# EasyEDA Pro project ProPrj_stm32桌面宠物_2024-10-04.epro

# Schematic stm32桌面宠物
Board Name: stm32桌面宠物; Create Date: 2024-09-05
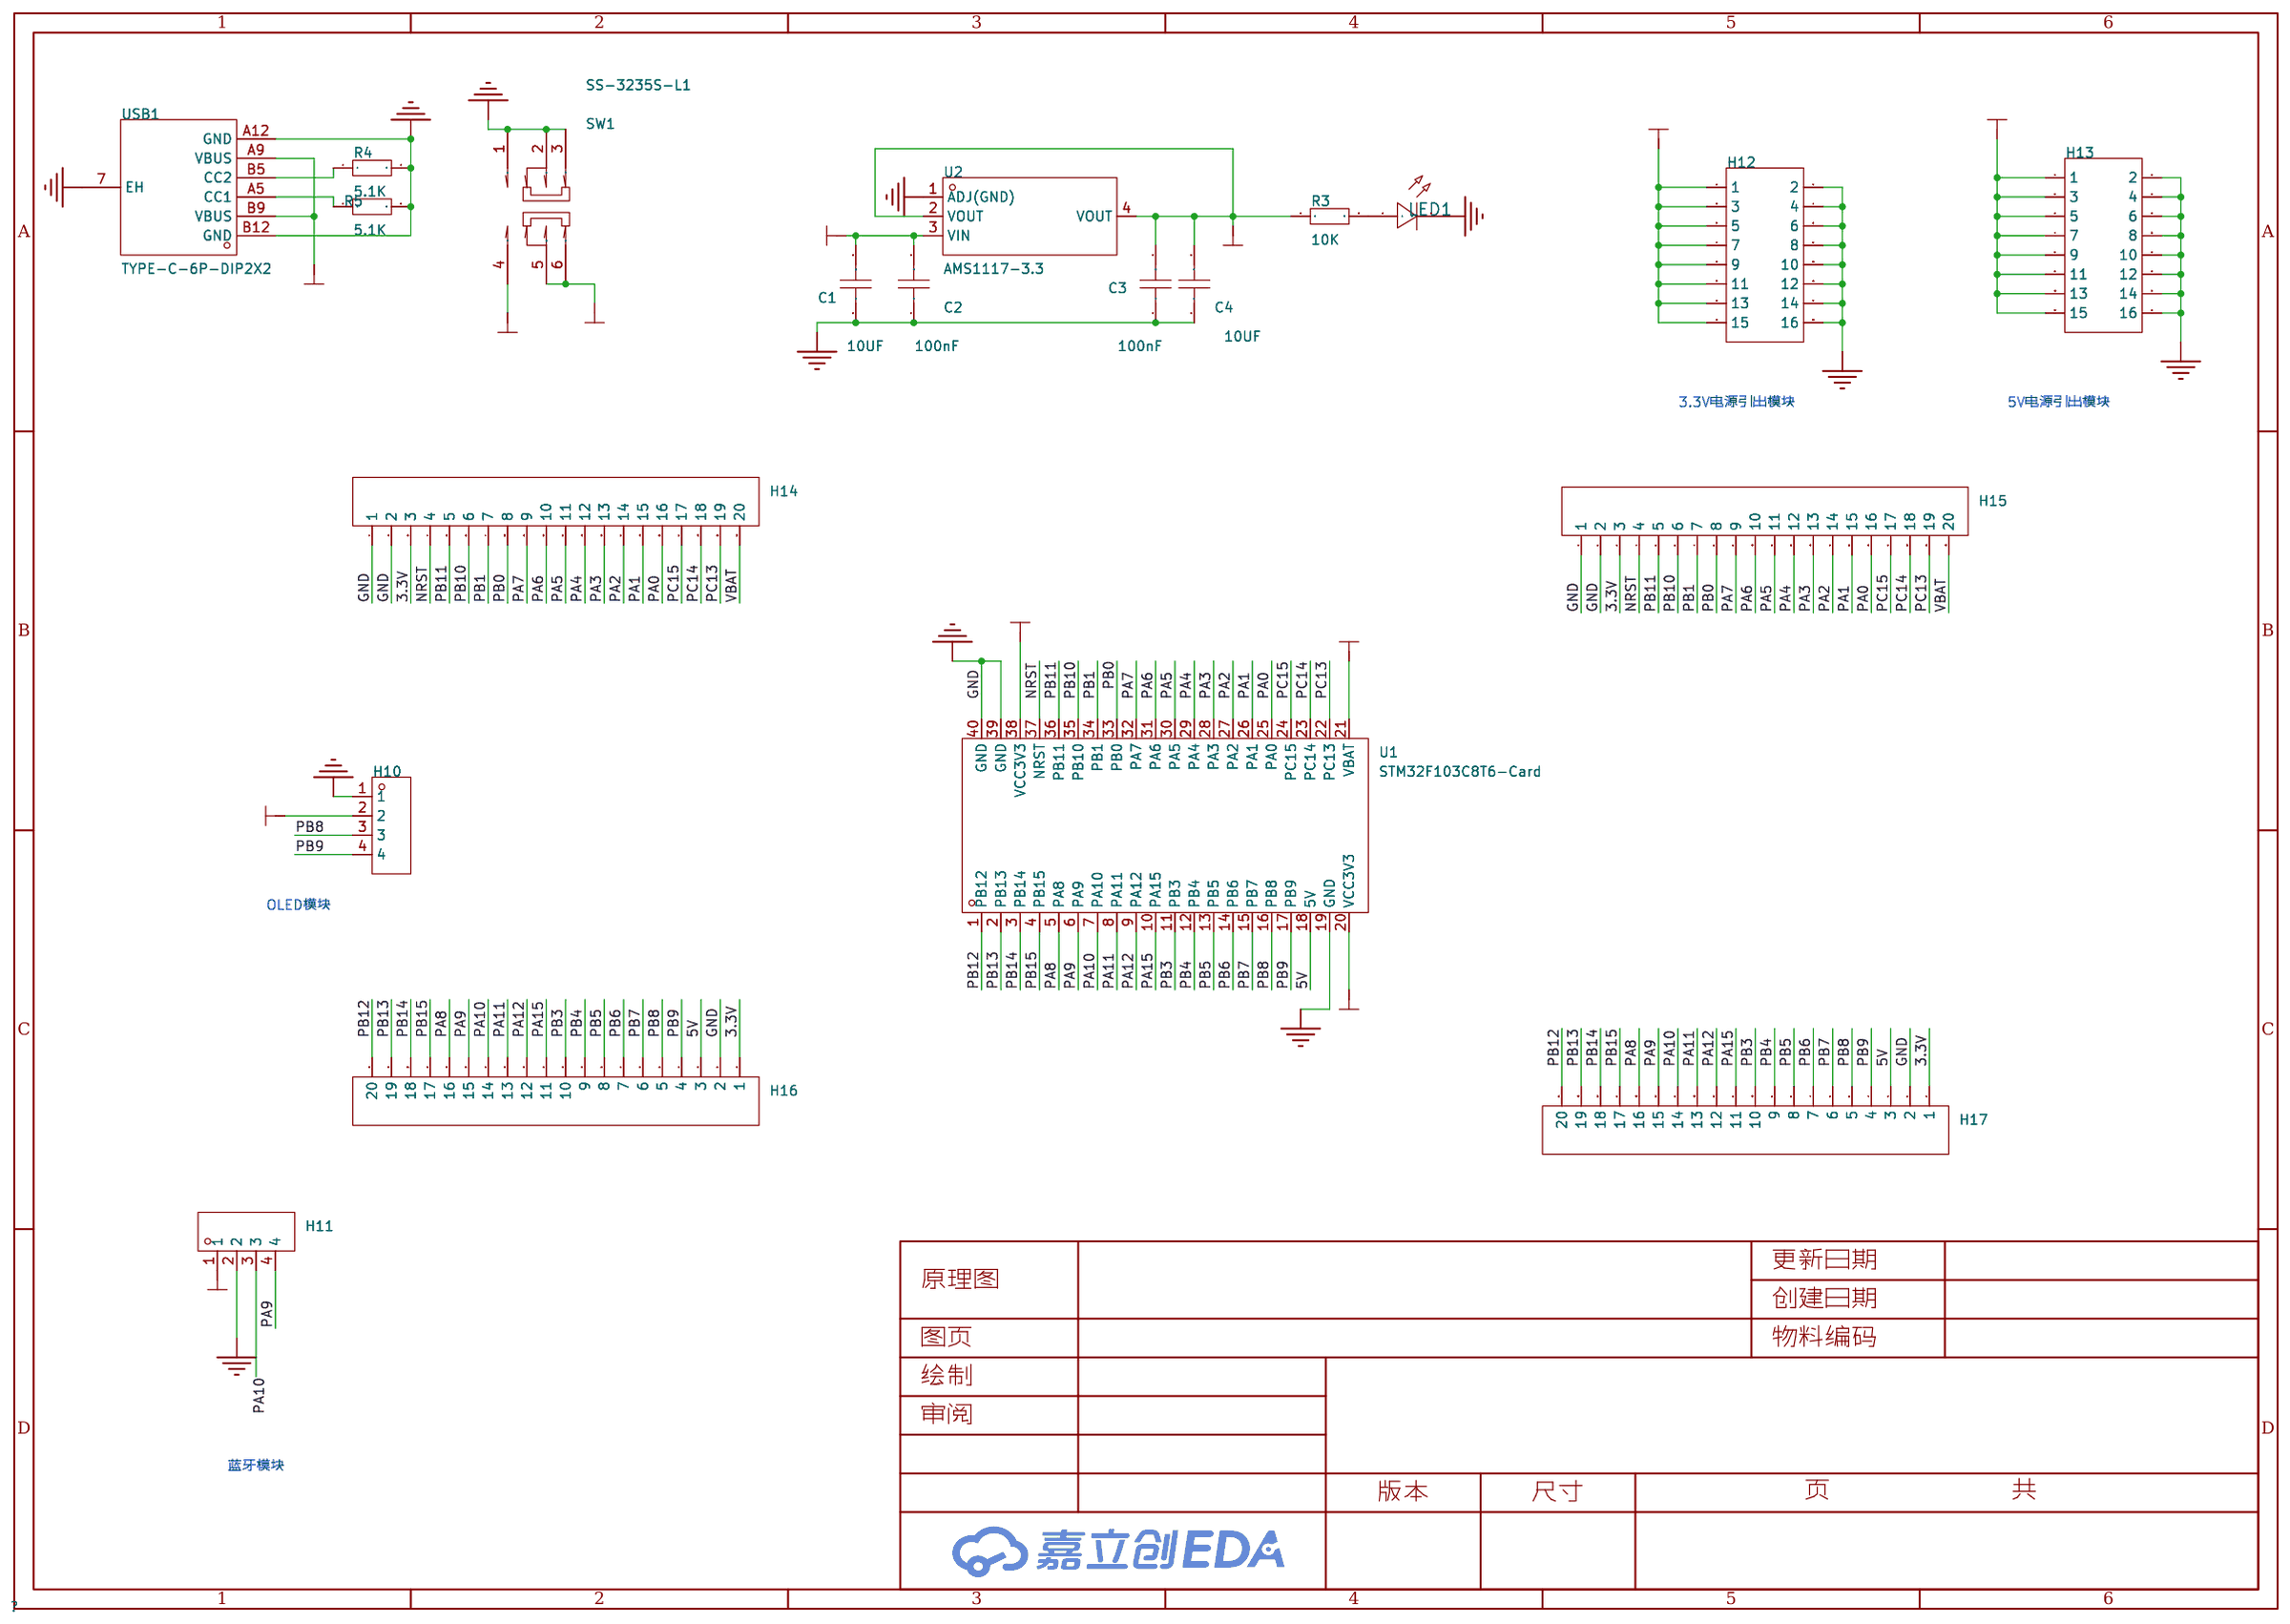
[diagram p0: schematic sheet]

## Parts
C1  10UF  [C0805]
C2  100nF  [C0805]
C3  100nF  [C0805]
C4  10UF  [C0805]
H10  -  [HDR-TH_4P-P2.54-V-F]
H11  -  [HDR-TH_4P-P2.54-V-F]
H12  -  [HDR-TH_16P-P2.54-V-M-R2-C8-S2.54]
H13  -  [HDR-TH_16P-P2.54-V-M-R2-C8-S2.54]
H14  -  [HDR-TH_20P-P2.54-V-F]
H15  -  [HDR-TH_20P-P2.54-V-F]
H16  -  [HDR-TH_20P-P2.54-V-F]
H17  -  [HDR-TH_20P-P2.54-V-F]
LED1  -  [LED_0805]
R3  10K  [R0805]
R4  5.1K  [R0805]
R5  5.1K  [R0805]
SW1  SS-3235S-L1  [SW-SMD_SS-3235S-LX]
U1  STM32F103C8T6-Card  [CONN-TH_L53.3-W22.9_STM32F103C8T6-CARD]
U2  AMS1117-3.3  [SOT-223-3_L6.5-W3.4-P2.30-LS7.0-BR]
USB1  TYPE-C-6P-DIP2X2  [TYPE-C-SMD_TYPE-C-6P]

## Library data of the parts
C1-C4 = CAP_0805: Supplier Footprint: 0805
H10 H11 = HDR-F_2.54_1x4P: Supplier Part: C2718488; Supplier Footprint: 插件
H12 H13 = HDR-M_2.54_2x8: Supplier Part: C68234; Supplier Footprint: 插件,P=2.54mm
H14-H17 = HDR-F_2.54_1x20P: Supplier Part: C50984; Supplier Footprint: 插件
LED1 = LED_0805-R: Supplier Footprint: 0805
R3-R5 = Res_0805: Supplier Footprint: 0805
SW1 = SS-3235S-L1: 电路结构:双刀双掷;安装方式:卧贴;开关颜色:黑色;额定电流(DC):50mA;额定电压(DC):12V;额定电流(AC):50mA;额定电压(AC):12V;机械寿命:1万次;; LCSC Part Name: 柄长2mm 卧贴双档 滑动开关; Supplier Part: C500055; Manufacturer: XKB Connectivity(中国星坤); Supplier Footprint: SMD; JLCPCB Part Class: 扩展库; Datasheet: https://atta.szlcsc.com/upload/public/pdf/source/20211011/39D516E750C13BE9339464E723D9F132.pdf; Supplier: LCSC; Circuit: 双刀双掷; Actuator Style: 矩形柱状; Pin Style: 鸥翼型; Switch Length: 9.1mm; Switch Width: 3.55mm; Switch Height: 3.2mm; Mounting Style: 卧贴; Actuator Color: 黑色; Current Rating (DC): 50mA; Voltage Rating (DC): 12V; Current Rating (AC): 50mA; Voltage Rating (AC): 12V; Mechanical Life: 1万次; Operating Temperature: -40℃~+85℃
U1 = STM32F103C8T6-Card: Supplier Part: C9900077949; Supplier Footprint: 插件; Supplier: LCSC
U2 = AMS1117-3.3: 输出类型:固定;最大输入电压:18V;输出电压:3.3V;最大输出电流:1A;电源纹波抑制比(PSRR):60dB@(120Hz);输出极性:正极;; LCSC Part Name: 输入18V 输出3.3V 1A; Supplier Part: C2891839; Manufacturer: YONGYUTAI(永裕泰); Supplier Footprint: SOT-223-3; JLCPCB Part Class: 扩展库; Datasheet: https://atta.szlcsc.com/upload/public/pdf/source/20210901/A75ADDE6A17DEE0002F2A58A8D1F3634.pdf; Supplier: LCSC; Output Type: 固定; Maximum Input Voltage: 18V; Output Voltage: 3.3V; MAX Output Current: 1A; Power Supply Rejection Ratio (PSRR): 60dB@(120Hz); Dropout Voltage: 1.3V@(1A); standby current: 5mA; Noise: 0.005%Vout; Operating Temperature: -40℃~+125℃@(Tj); Output Polarity: 正极; Number of Outputs: 1
USB1 = TYPE-C-6P-DIP2X2: Supplier Part: C9900017627; Supplier Footprint: TYPE-C-6P; JLCPCB Part Class: 扩展库; Supplier: LCSC

## Nets
3.3V: C3.2 C4.2 H10.2 H11.1 H12.1 H12.3 H12.5 H12.7 H12.9 H12.11 H12.13 H12.15 H14.3 H15.3 H16.1 H17.1 R3.1 U1.20(VCC3V3) U1.21(VBAT) U1.38(VCC3V3) U2.2(VOUT) U2.4(VOUT)
5V: C1.2 C2.2 H13.1 H13.3 H13.5 H13.7 H13.9 H13.11 H13.13 H13.15 H16.3 H17.3 SW1.5 SW1.6 U1.18(5V) U2.3(VIN)
GND: C1.1 C2.1 C3.1 C4.1 H10.1 H11.2 H12.2 H12.4 H12.6 H12.8 H12.10 H12.12 H12.14 H12.16 H13.2 H13.4 H13.6 H13.8 H13.10 H13.12 H13.14 H13.16 H14.1 H14.2 H15.1 H15.2 H16.2 H17.2 LED1.1(C) R4.2 R5.2 SW1.1 SW1.2 SW1.3 U1.19(GND) U1.39(GND) U1.40(GND) U2.1(ADJ(GND)) USB1.7(EH) USB1.A12(GND) USB1.B12(GND)
VBAT: H14.20 H15.20
VCC5V: SW1.4 USB1.A9(VBUS) USB1.B9(VBUS)
NRST: H14.4 H15.4 U1.37(NRST)
PA0: H14.16 H15.16 U1.25(PA0)
PA1: H14.15 H15.15 U1.26(PA1)
PA2: H14.14 H15.14 U1.27(PA2)
PA3: H14.13 H15.13 U1.28(PA3)
PA4: H14.12 H15.12 U1.29(PA4)
PA5: H14.11 H15.11 U1.30(PA5)
PA6: H14.10 H15.10 U1.31(PA6)
PA7: H14.9 H15.9 U1.32(PA7)
PA8: H16.16 H17.16 U1.5(PA8)
PA9: H11.4 H16.15 H17.15 U1.6(PA9)
PA10: H11.3 H16.14 H17.14 U1.7(PA10)
PA11: H16.13 H17.13 U1.8(PA11)
PA12: H16.12 H17.12 U1.9(PA12)
PA15: H16.11 H17.11 U1.10(PA15)
PB0: H14.8 H15.8 U1.33(PB0)
PB1: H14.7 H15.7 U1.34(PB1)
PB3: H16.10 H17.10 U1.11(PB3)
PB4: H16.9 H17.9 U1.12(PB4)
PB5: H16.8 H17.8 U1.13(PB5)
PB6: H16.7 H17.7 U1.14(PB6)
PB7: H16.6 H17.6 U1.15(PB7)
PB8: H10.3 H16.5 H17.5 U1.16(PB8)
PB9: H10.4 H16.4 H17.4 U1.17(PB9)
PB10: H14.6 H15.6 U1.35(PB10)
PB11: H14.5 H15.5 U1.36(PB11)
PB12: H16.20 H17.20 U1.1(PB12)
PB13: H16.19 H17.19 U1.2(PB13)
PB14: H16.18 H17.18 U1.3(PB14)
PB15: H16.17 H17.17 U1.4(PB15)
PC13: H14.19 H15.19 U1.22(PC13)
PC14: H14.18 H15.18 U1.23(PC14)
PC15: H14.17 H15.17 U1.24(PC15)
$1N801: R4.1 USB1.B5(CC2)
$1N805: R5.1 USB1.A5(CC1)
$1N1622: LED1.2(A) R3.2

## Notes on the sheet
- 3.3V电源引出模块
- 5V电源引出模块
- OLED模块
- 蓝牙模块

# Board stm32桌面宠物
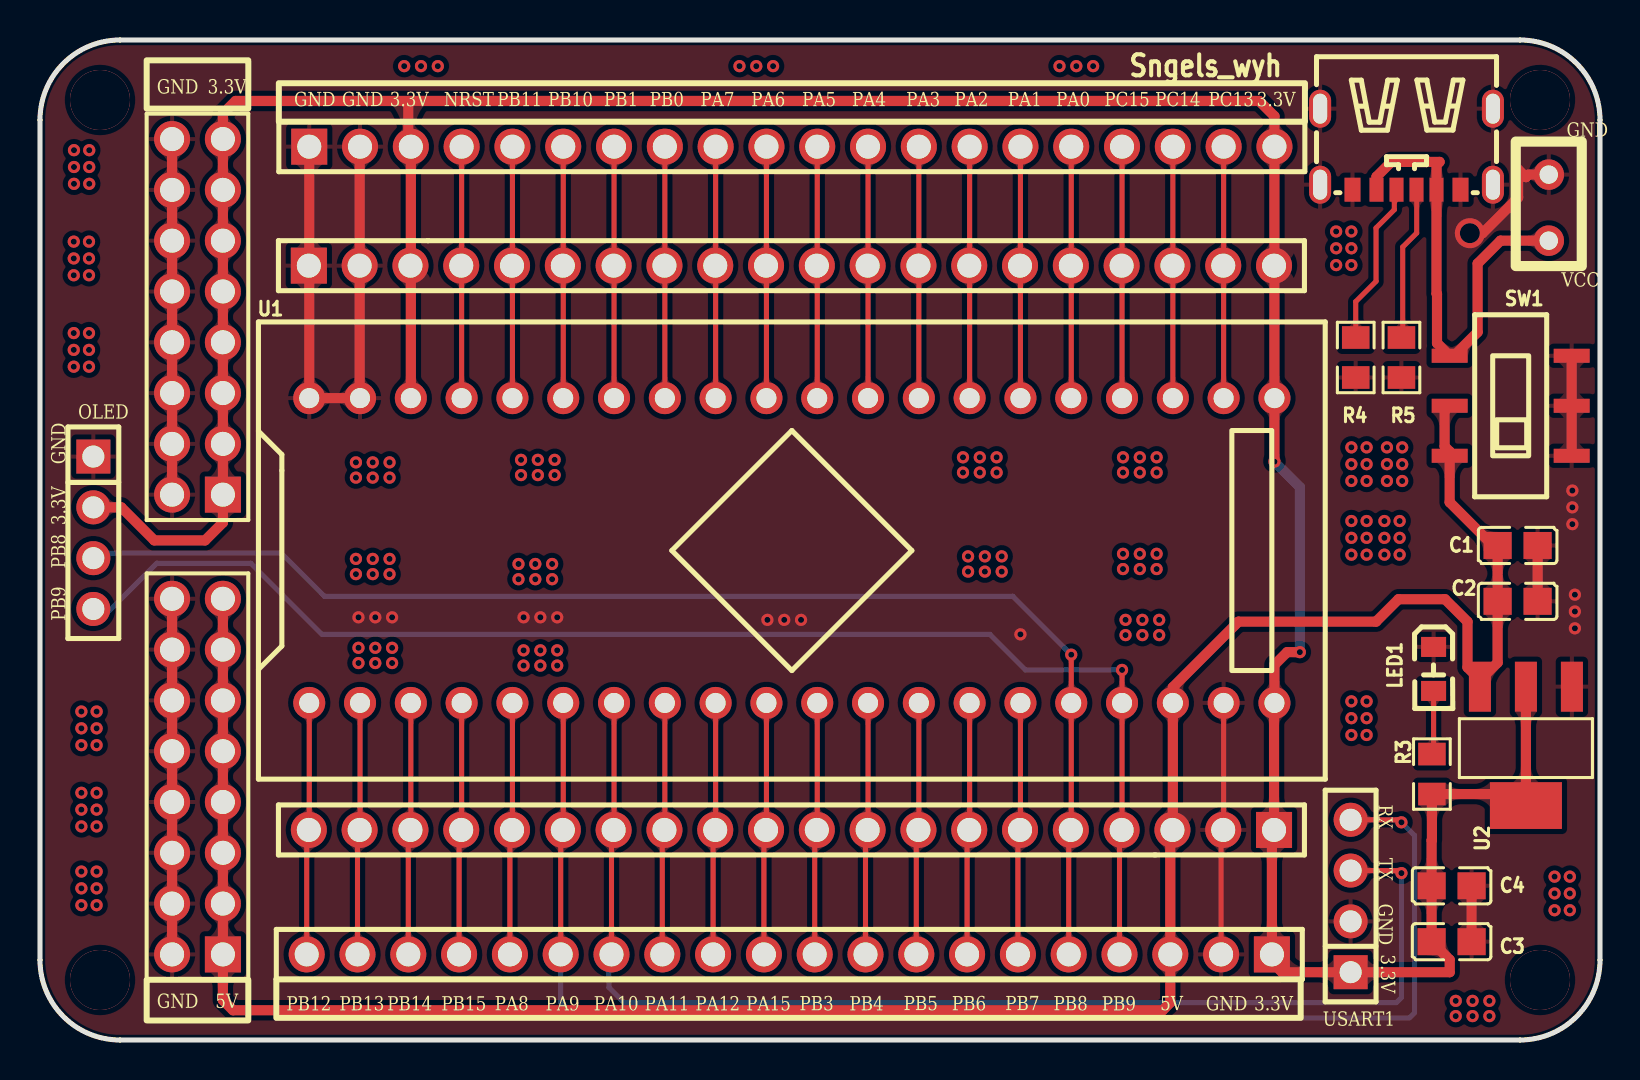
[diagram p1: board, top side]
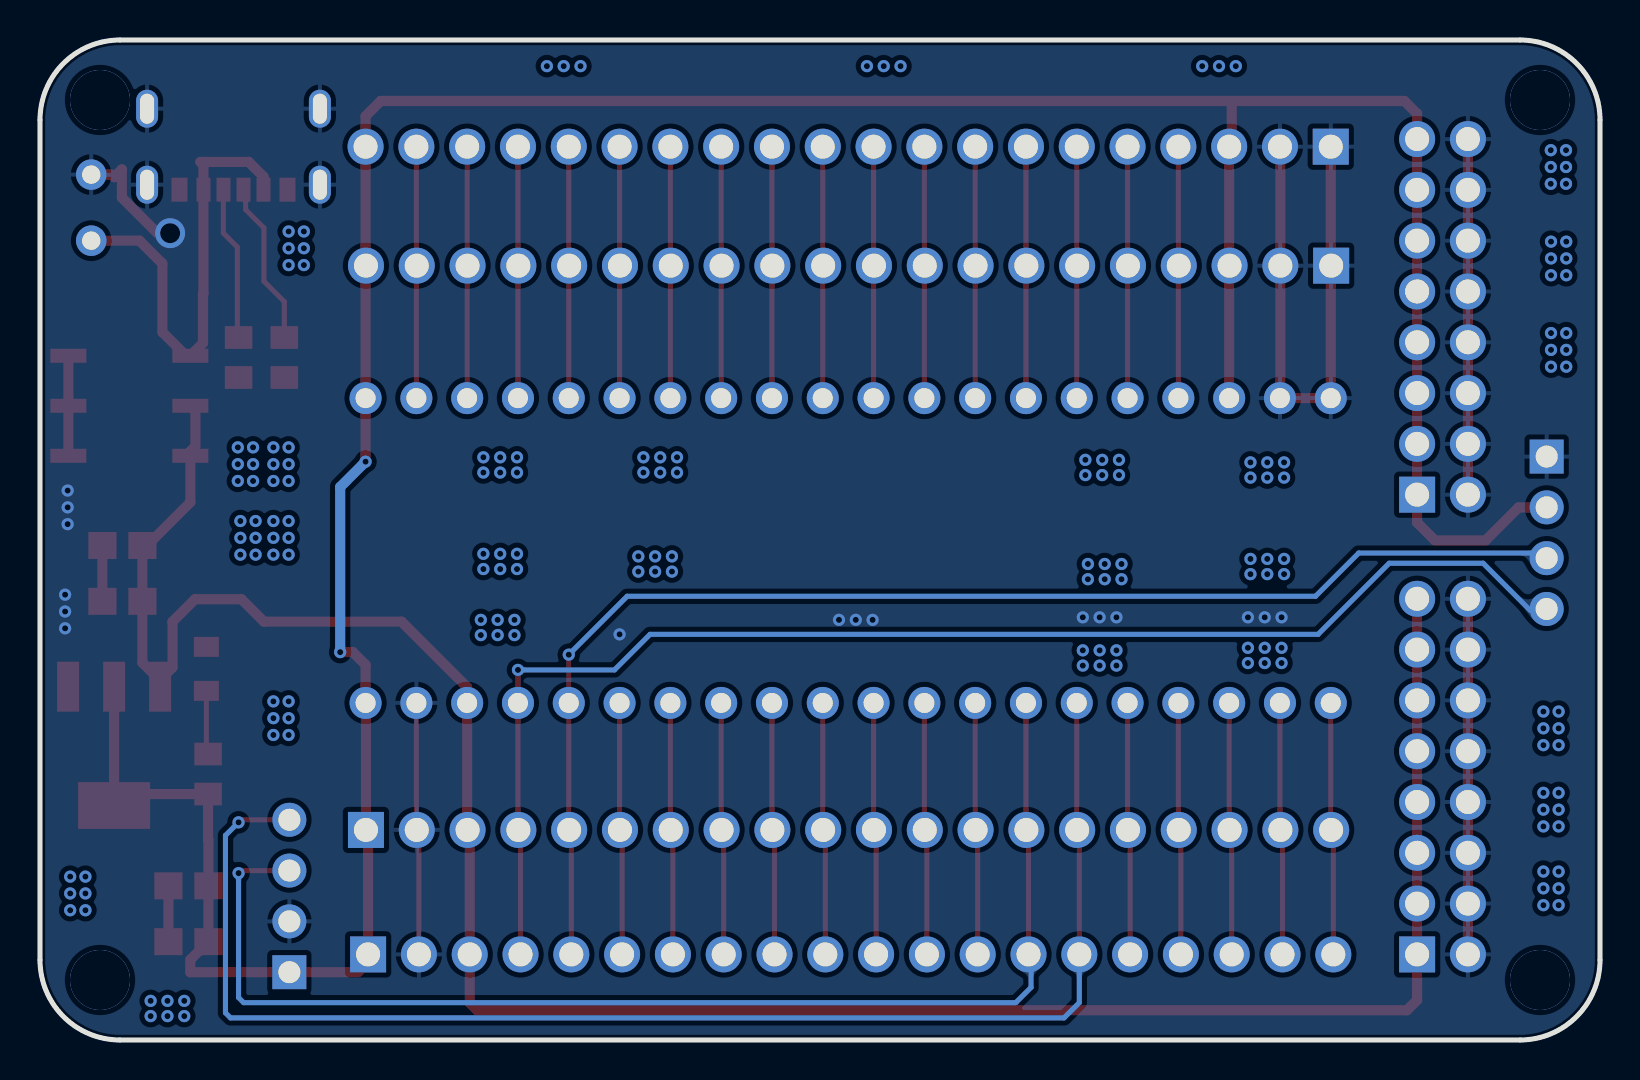
[diagram p2: board, bottom side, seen from below]

Outline 78 x 50 mm; copper layers: Top Layer, Bottom Layer. Coordinates in mm from the lower left corner of the outline.
Outline path: 0,46 0,4 arc(1.17,1.17) 4,0 74,0 arc(76.83,1.17) 78,4 78,46 arc(76.83,48.83) 74,50 4,50 arc(1.17,48.83) 0,46
Stack: Top Layer 0.035mm / Dielectric1 1.51mm FR4 er 4.5 / Bottom Layer 0.035mm

## Design rules (mm)
template: JLCPCB Capability(Two Layers Board)
spacing copperThickness1oz (default): track to track 0.102, other pairs 0.152 to 0.3
spacing copperThickness2oz: track to track 0.203, other pairs 0.152 to 0.3
track width copperThickness1oz (default): min 0.127, default 0.254, max 2.54
track width copperThickness2oz: min 0.203, default 0.254, max 2.54
differential pair differentialPair (default): width min 0.127, default 0.254, max 2.54; gap min 0.152, default 0.152
via viaSize (default): diameter min 0.5, default 0.61, max 10; hole min 0.3, default 0.305, max 6.3

## Placement (name value [footprint] x y rotation side)
C1  10UF  [C0805]  73.88 24.73 180 top
C2  100nF  [C0805]  73.88 21.93 180 top
C3  100nF  [C0805]  70.58 4.92 180 top
C4  10UF  [C0805]  70.58 7.71 180 top
H10  -  [HDR-TH_4P-P2.54-V-F]  2.67 25.36 270 top
H11  -  [HDR-TH_4P-P2.54-V-F]  65.53 7.2 90 top
H12  -  [HDR-TH_16P-P2.54-V-M-R2-C8-S2.54]  7.87 36.16 90 top
H13  -  [HDR-TH_16P-P2.54-V-M-R2-C8-S2.54]  7.87 13.17 90 top
H14  -  [HDR-TH_20P-P2.54-V-F]  37.59 44.67 0 top
H15  -  [HDR-TH_20P-P2.54-V-F]  37.57 38.72 0 top
H16  -  [HDR-TH_20P-P2.54-V-F]  37.57 10.5 180 top
H17  -  [HDR-TH_20P-P2.54-V-F]  37.47 4.28 180 top
LED1  -  [LED_0805]  69.67 18.5 270 top
NOREF  -  [Pad_e5]  75.44 43.27 0 top
NOREF#2  -  [Pad_e6]  75.44 39.97 0 top
R3  10K  [R0805]  69.6 13.3 90 top
R4  5.1K  [R0805]  65.79 34.12 270 top
R5  5.1K  [R0805]  68.07 34.12 270 top
SW1  SS-3235S-L1  [SW-SMD_SS-3235S-LX]  73.53 31.71 270 top
U1  STM32F103C8T6-Card  [CONN-TH_L53.3-W22.9_STM32F103C8T6-CARD]  37.59 24.47 0 top
U2  AMS1117-3.3  [SOT-223-3_L6.5-W3.4-P2.30-LS7.0-BR]  74.29 14.69 90 top
USB1  TYPE-C-6P-DIP2X2  [TYPE-C-SMD_TYPE-C-6P]  68.33 44.54 180 top

## Footprints (pads in the part's own frame, mm; a bottom-side part is the same pattern mirrored in y, then rotated)
C0805
  rect 1.41x1.35 smd: 1(-1,0) 2(1,0)
CONN-TH_L53.3-W22.9_STM32F103C8T6-CARD
  round 1.6 hole 1: 1(-24.13,-7.62) 2(-21.59,-7.62) 3(-19.05,-7.62) 4(-16.51,-7.62) 5(-13.97,-7.62) 6(-11.43,-7.62) 7(-8.89,-7.62) 8(-6.35,-7.62) 9(-3.81,-7.62) 10(-1.27,-7.62) 11(1.27,-7.62) 12(3.81,-7.62) 13(6.35,-7.62) 14(8.89,-7.62) 15(11.43,-7.62) 16(13.97,-7.62) 17(16.51,-7.62) 18(19.05,-7.62) 19(21.59,-7.62) 20(24.13,-7.62) 21(24.13,7.62) 22(21.59,7.62) 23(19.05,7.62) 24(16.51,7.62) 25(13.97,7.62) 26(11.43,7.62) 27(8.89,7.62) 28(6.35,7.62) 29(3.81,7.62) 30(1.27,7.62) 31(-1.27,7.62) 32(-3.81,7.62) 33(-6.35,7.62) 34(-8.89,7.62) 35(-11.43,7.62) 36(-13.97,7.62) 37(-16.51,7.62) 38(-19.05,7.62) 39(-21.59,7.62) 40(-24.13,7.62)
HDR-TH_4P-P2.54-V-F
  rect 1.7x1.7 hole 1.1: 1(-3.81,0)
  round 1.7 hole 1.1: 2(-1.27,0) 3(1.27,0) 4(3.81,0)
HDR-TH_16P-P2.54-V-M-R2-C8-S2.54
  rect 1.8x1.8 hole 1.2: 1(-8.89,-1.27)
  round 1.8 hole 1.2: 2(-8.89,1.27) 3(-6.35,-1.27) 4(-6.35,1.27) 5(-3.81,-1.27) 6(-3.81,1.27) 7(-1.27,-1.27) 8(-1.27,1.27) 9(1.27,-1.27) 10(1.27,1.27) 11(3.81,-1.27) 12(3.81,1.27) 13(6.35,-1.27) 14(6.35,1.27) 15(8.89,-1.27) 16(8.89,1.27)
HDR-TH_20P-P2.54-V-F
  rect 1.8x1.8 hole 1.2: 1(-24.13,0)
  round 1.8 hole 1.2: 2(-21.59,0) 3(-19.05,0) 4(-16.51,0) 5(-13.97,0) 6(-11.43,0) 7(-8.89,0) 8(-6.35,0) 9(-3.81,0) 10(-1.27,0) 11(1.27,0) 12(3.81,0) 13(6.35,0) 14(8.89,0) 15(11.43,0) 16(13.97,0) 17(16.51,0) 18(19.05,0) 19(21.59,0) 20(24.13,0)
LED_0805
  rect 1x1.25 smd: 1(-1.15,0.005) 2(1.05,0.005)
Pad_e5
  round 1.524 hole 0.914: 1(0,0)
Pad_e6
  round 1.524 hole 0.914: 2(0,0)
R0805
  rect 1.133x1.377 smd: 1(-1,0) 2(1,0)
SOT-223-3_L6.5-W3.4-P2.30-LS7.0-BR
  rect 2.5x1.1 smd: 1(2.97,-2.3) 2(2.97,0) 3(2.97,2.3)
  rect 2.34x3.6 smd: 4(-2.97,0)
SW-SMD_SS-3235S-LX
  rect 0.7x1.8 smd: 1(-2.5,3.05) 2(0,3.05) 3(2.5,3.05) 4(-2.5,-3.05) 5(0,-3.05) 6(2.5,-3.05)
TYPE-C-SMD_TYPE-C-6P
  oval 1.1x1.9 hole 0.7x1.5: 7(-4.32,1.775) 7(-4.32,-2.025) 7(4.32,1.775) 7(4.32,-2.025)
  rect 0.7x1.2 smd: A5(-0.5,2.025) A9(1.5,2.025) B5(0.5,2.025) B9(-1.5,2.025)
  rect 0.8x1.2 smd: A12(2.7,2.025) B12(-2.7,2.025)

## Nets
As in the schematic, except:
3.3V: C3.2 C4.2 H10.2 H11.1 H12.1 H12.3 H12.5 H12.7 H12.9 H12.11 H12.13 H12.15 H14.3 H14.20 H15.3 H15.20 H16.1 H17.1 R3.1 U1.20 U1.21 U1.38 U2.2 U2.4
GND: C1.1 C2.1 C3.1 C4.1 H10.1 H11.2 H12.2 H12.4 H12.6 H12.8 H12.10 H12.12 H12.14 H12.16 H13.2 H13.4 H13.6 H13.8 H13.10 H13.12 H13.14 H13.16 H14.1 H14.2 H15.1 H15.2 H16.2 H17.2 LED1.1 NOREF.1 R4.2 R5.2 SW1.1 SW1.2 SW1.3 U1.19 U1.39 U1.40 U2.1 USB1.7 USB1.A12 USB1.B12
VCC5V: NOREF#2.2 SW1.4 USB1.A9 USB1.B9

## Via types
v1: diameter 0.61, hole 0.305, Top Layer to Bottom Layer, 181 vias
v2: diameter 3, hole 3, Top Layer to Bottom Layer, 4 vias
v3: diameter 1.5, hole 1, Top Layer to Bottom Layer, 1 via

## Routing (per net, layer and track width the routed paths; a pad name or vN(x,y) marks a point on that pad's centre or on a via; arc(x,y) is an arc through that point)
3.3V: length 169.5
  Top Layer w0.508: 18.41,46.95 9.78,46.95 9.14,46.32 H12.15 H12.11 H12.7 H12.5 H12.3 H12.1 9.14,25.87 8.25,24.98 5.72,24.98 4.06,26.63 H10.2 ; 18.41,46.95 60.96,46.95 61.72,46.19 H14.20 61.72,38.74 H15.20 61.72,38.7 U1.21 v1(61.72,28.92) ; 18.41,46.95 18.41,44.79 H14.3 18.54,38.74 H15.3 18.54,38.7 U1.38 ; U2.2 U2.4 73.72,12.3 R3.1 69.6,10 69.58,9.98 C4.2 69.85,7.71 69.58,7.44 C3.2 70.49,4.01 70.49,3.39 62.1,3.39 61.59,3.9 H17.1 61.59,10.4 H16.1 61.7,16.83 U1.20 61.72,18.76 62.36,19.39 v1(62.99,19.39)
  Bottom Layer w0.508: v1(61.72,28.92) 62.99,27.65 v1(62.99,19.39)
5V: length 119.6
  Top Layer w0.508: 72,17.98 72,18.01 71.37,18.63 71.37,20.92 70.25,22.04 67.92,22.04 66.8,20.92 59.92,20.92 56.64,17.64 U1.18 56.64,10.52 H16.3 56.51,10.4 H17.3 56.51,1.87 56.13,1.49 9.65,1.49 9.14,1.99 H13.1 H13.3 H13.5 H13.7 H13.9 H13.11 H13.13 H13.15 ; 72,17.98 72.88,18.87 C2.2 C1.2 72.64,24.73 70.48,26.89 70.48,29.43 70.23,29.68 70.23,31.46 70.48,31.71 ; 72,17.98 72,17.66
GND: length 92.3
  Top Layer w0.254: H17.2 59.06,10.4 H16.2 59.18,10.52 U1.19
  Top Layer w0.508: v3(71.49,40.34) 72.13,40.34 73.91,42.12 73.91,43.53 74.29,43.14 74.42,43.27 NOREF.1 ; C1.1 C2.1 ; H14.1 13.46,38.74 H15.1 13.46,38.7 U1.40 15.49,32.09 15.75,32.35 ; H14.2 15.98,44.65 H15.2 15.98,32.58 15.88,32.47 ; SW1.3 SW1.2 SW1.1 ; C3.1 C4.1 ; H12.16 H12.12 H12.8 H12.6 H12.4 H12.2 ; H13.16 H13.14 H13.12 H13.10 H13.8 H13.6 H13.4 H13.2
  vias: v1(15.92,21.13) v1(16.76,21.13) v1(17.6,21.13) v1(24.18,21.13) v1(25.02,21.13) v1(25.86,21.13) v1(36.37,21.01) v1(37.21,21.01) v1(38.05,21.01) v1(49.02,20.28) v1(76.62,27.47) v1(76.62,26.63) v1(76.62,25.79) v1(76.75,22.27) v1(76.75,21.42) v1(76.75,20.58)
VCC5V: length 23.5
  Top Layer w0.508: NOREF#2.2 73.03,39.97 71.88,38.82 71.88,35.39 70.7,34.21 70.48,34.21 69.85,34.84 69.85,37.3 69.83,37.32 USB1.B9 69.83,43.75 69.98,43.9 67.56,43.9 66.83,43.17 USB1.A9
(no net):
  vias: v1(1.7,44.49) v1(1.7,43.65) v1(1.7,42.81) v1(1.69,39.92) v1(1.69,39.08) v1(1.69,38.24) v1(1.69,35.35) v1(1.69,34.51) v1(1.69,33.67) v1(2.07,16.42) v1(2.07,15.58) v1(2.07,14.74) v1(2.07,12.36) v1(2.07,11.52) v1(2.07,10.68) v1(2.07,8.42) v1(2.07,7.58) v1(2.07,6.74) v1(2.46,44.49) v1(2.46,43.65) v1(2.46,42.81) v1(2.45,39.92) v1(2.45,39.08) v1(2.45,38.24) v1(2.45,35.35) v1(2.45,34.51) v1(2.45,33.67) v1(2.83,16.42) v1(2.83,15.58) v1(2.83,14.74) v1(2.83,12.36) v1(2.83,11.52) v1(2.83,10.68) v1(2.83,8.42) v1(2.83,7.58) v1(2.83,6.74) v1(15.8,28.88) v1(15.8,28.12) v1(15.8,24.06) v1(15.8,23.29) v1(15.92,19.61) v1(15.92,18.85) v1(16.64,28.88) v1(16.64,28.12) v1(16.64,24.06) v1(16.64,23.29) v1(16.76,19.61) v1(16.76,18.85) v1(17.48,28.88) v1(17.48,28.12) v1(17.48,24.06) v1(17.48,23.29) v1(17.6,19.61) v1(17.6,18.85) v1(18.21,48.69) v1(19.05,48.69) v1(19.89,48.69) v1(23.92,23.8) v1(23.92,23.04) v1(24.05,29.01) v1(24.05,28.25) v1(24.18,19.48) v1(24.18,18.72) v1(24.76,23.8) v1(24.76,23.04) v1(24.89,29.01) v1(24.89,28.25) v1(25.02,19.48) v1(25.02,18.72) v1(25.61,23.8) v1(25.61,23.04) v1(25.73,29.01) v1(25.73,28.25) v1(25.86,19.48) v1(25.86,18.72) v1(34.97,48.69) v1(35.81,48.69) v1(36.65,48.69) v1(46.15,29.14) v1(46.15,28.37) v1(46.4,24.18) v1(46.4,23.42) v1(46.99,29.14) v1(46.99,28.37) v1(47.24,24.18) v1(47.24,23.42) v1(47.83,29.14) v1(47.83,28.37) v1(48.08,24.18) v1(48.08,23.42) v1(50.98,48.69) v1(51.82,48.69) v1(52.66,48.69) v1(54.15,29.14) v1(54.15,28.37) v1(54.15,24.31) v1(54.15,23.55) v1(54.28,21.01) v1(54.28,20.25) v1(54.99,29.14) v1(54.99,28.37) v1(54.99,24.31) v1(54.99,23.55) v1(55.12,21.01) v1(55.12,20.25) v1(55.83,29.14) v1(55.83,28.37) v1(55.83,24.31) v1(55.83,23.55) v1(55.96,21.01) v1(55.96,20.25) v1(64.81,40.43) v1(64.81,39.59) v1(64.81,38.75) v1(65.57,40.43) v1(65.57,39.59) v1(65.57,38.75) v1(65.57,29.63) v1(65.57,28.79) v1(65.57,27.95) v1(65.57,25.95) v1(65.57,25.11) v1(65.57,24.27) v1(65.57,16.93) v1(65.57,16.09) v1(65.57,15.25) v1(66.33,29.63) v1(66.33,28.79) v1(66.33,27.95) v1(66.33,25.95) v1(66.33,25.11) v1(66.33,24.27) v1(66.33,16.93) v1(66.33,16.09) v1(66.33,15.25) v1(67.22,25.95) v1(67.22,25.11) v1(67.22,24.27) v1(67.35,29.63) v1(67.35,28.79) v1(67.35,27.95) v1(67.98,25.95) v1(67.98,25.11) v1(67.98,24.27) v1(68.11,29.63) v1(68.11,28.79) v1(68.11,27.95) v1(70.79,1.96) v1(70.79,1.19) v1(71.63,1.96) v1(71.63,1.19) v1(72.47,1.96) v1(72.47,1.19) v1(75.73,8.17) v1(75.73,7.33) v1(75.73,6.49) v1(76.49,8.17) v1(76.49,7.33) v1(76.49,6.49) v2(3,47) v2(3,3) v2(75,47) v2(75,3)
NRST: length 12.6
  Top Layer w0.254: H14.4 21.08,38.74 H15.4 21.08,38.7 U1.37
PA0: length 12.6
  Top Layer w0.254: H14.16 51.56,38.74 H15.16 51.56,38.7 U1.25
PA1: length 12.6
  Top Layer w0.254: H14.15 49.02,38.74 H15.15 49.02,38.7 U1.26
PA2: length 12.6
  Top Layer w0.254: U1.27 46.48,38.7 H15.14 46.48,38.74 H14.14
PA3: length 12.6
  Top Layer w0.254: H14.13 43.94,38.74 H15.13 43.94,38.7 U1.28
PA4: length 12.6
  Top Layer w0.254: H14.12 41.4,38.74 H15.12 41.4,38.7 U1.29
PA5: length 12.6
  Top Layer w0.254: U1.30 38.86,38.7 H15.11 38.86,38.74 H14.11
PA6: length 12.6
  Top Layer w0.254: U1.31 36.32,38.7 H15.10 36.32,38.74 H14.10
PA7: length 12.6
  Top Layer w0.254: U1.32 33.78,38.7 H15.9 33.78,38.74 H14.9
PA8: length 12.6
  Top Layer w0.254: H17.16 23.5,10.4 H16.16 23.62,10.52 U1.5
PA9: length 70.5
  Top Layer w0.254: U1.6 26.16,10.52 H16.15 26.03,10.4 H17.15 ; H11.4 67.94,11.01 v1(68.07,10.88)
  Bottom Layer w0.254: v1(68.07,10.88) 68.73,10.23 68.73,1.36 68.47,1.1 26.8,1.1 26.03,1.87 H17.15
PA10: length 63.2
  Top Layer w0.254: U1.7 28.7,10.52 H16.14 28.57,10.4 H17.14 ; v1(68.07,8.34) 67.94,8.47 65.53,8.47
  Bottom Layer w0.254: v1(68.07,8.34) 68.07,2.12 67.82,1.87 29.21,1.87 28.45,2.63 28.45,4.15 H17.14
PA11: length 12.6
  Top Layer w0.254: H17.13 31.12,10.4 H16.13 31.24,10.52 U1.8
PA12: length 12.6
  Top Layer w0.254: U1.9 33.78,10.52 H16.12 33.66,10.4 H17.12
PA15: length 12.6
  Top Layer w0.254: U1.10 36.32,10.52 H16.11 36.19,10.4 H17.11
PB0: length 12.6
  Top Layer w0.254: H14.8 31.24,38.74 H15.8 31.24,38.7 U1.33
PB1: length 12.6
  Top Layer w0.254: U1.34 28.7,38.7 H15.7 28.7,38.74 H14.7
PB3: length 12.6
  Top Layer w0.254: U1.11 38.86,10.52 H16.10 38.74,10.4 H17.10
PB4: length 12.6
  Top Layer w0.254: H17.9 41.28,10.4 H16.9 41.4,10.52 U1.12
PB5: length 12.6
  Top Layer w0.254: H17.8 43.81,10.4 H16.8 43.94,10.52 U1.13
PB6: length 12.6
  Top Layer w0.254: H17.7 46.35,10.4 H16.7 46.48,10.52 U1.14
PB7: length 12.6
  Top Layer w0.254: H17.6 48.9,10.4 H16.6 49.02,10.52 U1.15
PB8: length 66.1
  Top Layer w0.254: H17.5 51.44,10.4 H16.5 51.56,10.52 U1.16 v1(51.56,19.27)
  Bottom Layer w0.254: H10.3 2.92,24.35 12.06,24.35 14.22,22.19 48.64,22.19 v1(51.56,19.27)
PB9: length 68.9
  Top Layer w0.254: v1(54.1,18.5) U1.17 54.1,10.52 H16.4 53.97,10.4 H17.4
  Bottom Layer w0.254: H10.4 3.07,21.55 3.13,21.49 3.49,21.49 5.84,23.84 10.54,23.84 14.1,20.28 47.5,20.28 49.28,18.5 v1(54.1,18.5)
PB10: length 12.6
  Top Layer w0.254: U1.35 26.16,38.7 H15.6 26.16,38.74 H14.6
PB11: length 12.6
  Top Layer w0.254: U1.36 23.62,38.7 H15.5 23.62,38.74 H14.5
PB12: length 12.6
  Top Layer w0.254: U1.1 13.46,10.52 H16.20 13.33,10.4 H17.20
PB13: length 12.6
  Top Layer w0.254: H17.19 15.88,10.4 H16.19 16,10.52 U1.2
PB14: length 12.6
  Top Layer w0.254: H17.18 18.41,10.4 H16.18 18.54,10.52 U1.3
PB15: length 12.6
  Top Layer w0.254: H17.17 20.96,10.4 H16.17 21.08,10.52 U1.4
PC13: length 12.6
  Top Layer w0.254: H14.19 59.18,38.74 H15.19 59.18,38.7 U1.22
PC14: length 12.6
  Top Layer w0.254: H14.18 56.64,38.74 H15.18 56.64,38.7 U1.23
PC15: length 12.6
  Top Layer w0.254: U1.24 54.1,38.7 H15.17 54.1,38.74 H14.17
$1N801: length 8.2
  Top Layer w0.254: USB1.B5 67.83,42.44 67.74,42.35 67.74,41.94 67.72,41.91 67.72,41.52 66.8,40.6 66.8,37.94 65.79,36.92 R4.1
$1N805: length 7.7
  Top Layer w0.254: R5.1 68.14,35.19 68.14,39.65 68.83,40.35 68.83,42.51 USB1.A5
$1N1622: length 3.2
  Top Layer w0.254: LED1.2 69.68,14.38 R3.2

## Copper pours and planes (outline as drawn; the poured copper is in the pictures)
GND on Top Layer: -9.02,58.51 97.28,58.51 97.28,-9.94 -9.02,-9.94
GND on Bottom Layer: -11.05,59.91 91.95,59.91 91.95,-5.88 -11.05,-5.88

Small or netless copper shapes (teardrops, artwork), in the pictures only: 277 on Top Layer, 10 on Bottom Layer

## Text on the board
Top Silkscreen Layer: Sngels_wyh | OLED | GND | 3.3V | 5V | PB12 | PB13 | PB14 | PB15 | NRST | PA8 | PB11 | PA9 | PB10 | PA10 | PB1 | PA11 | PB0 | PA12 | PA7 | PA15 | PA6 | PB3 | PA5 | PB4 | PA4 | PB5 | PA3 | PB6 | PA2 | PB7 | PA1 | PB8 | PA0 | PB9 | PC15 | PC14 | PC13 | USART1 | VCC | RX | TX
